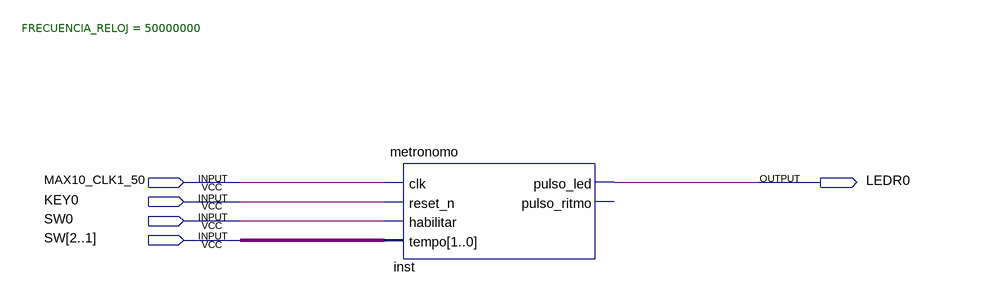
[diagram p0: schematic sheet]
// Quartus schematic top_metronomo_bdf.bdf as structural Verilog: 1 symbols, 5 pins
module top_metronomo_bdf (
  input  MAX10_CLK1_50,
  input  KEY0,
  input  SW0,
  input  [2:1] SW,
  output LEDR0
);

  metronomo #(.FRECUENCIA_RELOJ(50000000)) inst (
    .clk(MAX10_CLK1_50), .reset_n(KEY0), .habilitar(SW0), .tempo(SW), .pulso_led(LEDR0));  // open: pulso_ritmo
endmodule
